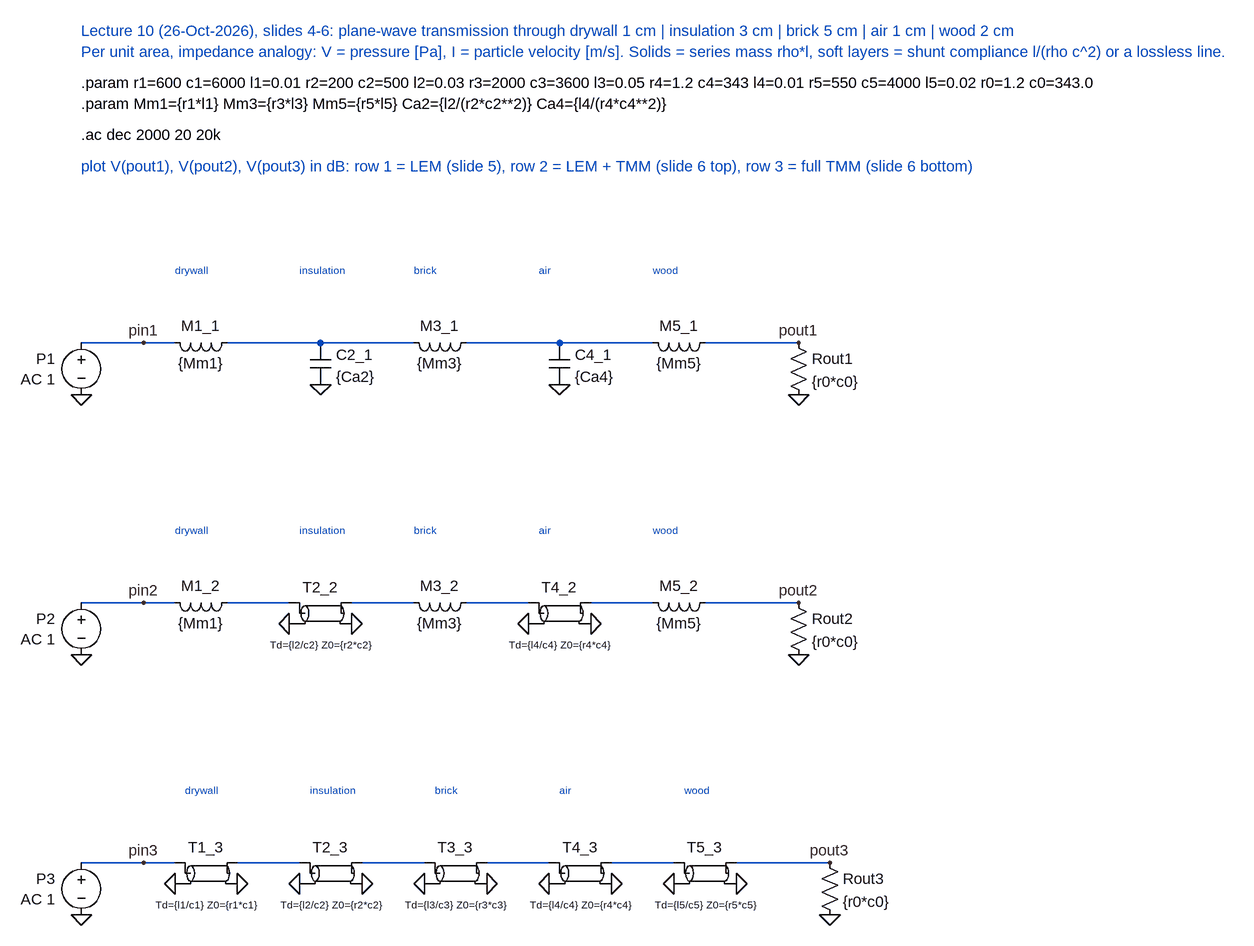
[diagram p0: schematic P10_Wall_LEM_TMM.asc]
P10_Wall_LEM_TMM.asc, the LTspice schematic file:
Version 4
SHEET 1 3000 1600
WIRE 0 0 96 0
WIRE 96 0 144 0
WIRE 224 0 272 0
WIRE 272 0 368 0
WIRE 368 0 464 0
WIRE 464 0 512 0
WIRE 592 0 640 0
WIRE 640 0 736 0
WIRE 736 0 832 0
WIRE 832 0 880 0
WIRE 960 0 1008 0
WIRE 1008 0 1104 0
WIRE 0 400 96 400
WIRE 96 400 144 400
WIRE 224 400 272 400
WIRE 272 400 320 400
WIRE 416 400 464 400
WIRE 464 400 512 400
WIRE 592 400 640 400
WIRE 640 400 688 400
WIRE 784 400 832 400
WIRE 832 400 880 400
WIRE 960 400 1008 400
WIRE 1008 400 1104 400
WIRE 0 800 96 800
WIRE 96 800 144 800
WIRE 240 800 288 800
WIRE 288 800 336 800
WIRE 432 800 480 800
WIRE 480 800 528 800
WIRE 624 800 672 800
WIRE 672 800 720 800
WIRE 816 800 864 800
WIRE 864 800 912 800
WIRE 1008 800 1056 800
WIRE 1056 800 1152 800
FLAG 0 80 0
FLAG 96 0 pin1
FLAG 368 64 0
FLAG 736 64 0
FLAG 1104 0 pout1
FLAG 1104 80 0
FLAG 0 480 0
FLAG 96 400 pin2
FLAG 320 432 0
FLAG 416 432 0
FLAG 688 432 0
FLAG 784 432 0
FLAG 1104 400 pout2
FLAG 1104 480 0
FLAG 0 880 0
FLAG 96 800 pin3
FLAG 144 832 0
FLAG 240 832 0
FLAG 336 832 0
FLAG 432 832 0
FLAG 528 832 0
FLAG 624 832 0
FLAG 720 832 0
FLAG 816 832 0
FLAG 912 832 0
FLAG 1008 832 0
FLAG 1152 800 pout3
FLAG 1152 880 0
SYMBOL voltage 0 -16 R0
WINDOW 0 -40 40 Right 2
WINDOW 3 -40 72 Right 2
SYMATTR InstName P1
SYMATTR Value AC 1
SYMBOL ind 240 -16 R90
WINDOW 0 5 56 VBottom 2
WINDOW 3 32 56 VTop 2
SYMATTR InstName M1_1
SYMATTR Value {Mm1}
SYMATTR SpiceLine Rser=0
SYMBOL cap 352 0 R0
WINDOW 0 40 18 Left 2
WINDOW 3 40 52 Left 2
SYMATTR InstName C2_1
SYMATTR Value {Ca2}
SYMBOL ind 608 -16 R90
WINDOW 0 5 56 VBottom 2
WINDOW 3 32 56 VTop 2
SYMATTR InstName M3_1
SYMATTR Value {Mm3}
SYMATTR SpiceLine Rser=0
SYMBOL cap 720 0 R0
WINDOW 0 40 18 Left 2
WINDOW 3 40 52 Left 2
SYMATTR InstName C4_1
SYMATTR Value {Ca4}
SYMBOL ind 976 -16 R90
WINDOW 0 5 56 VBottom 2
WINDOW 3 32 56 VTop 2
SYMATTR InstName M5_1
SYMATTR Value {Mm5}
SYMATTR SpiceLine Rser=0
SYMBOL res 1088 -16 R0
SYMATTR InstName Rout1
SYMATTR Value {r0*c0}
SYMBOL voltage 0 384 R0
WINDOW 0 -40 40 Right 2
WINDOW 3 -40 72 Right 2
SYMATTR InstName P2
SYMATTR Value AC 1
SYMBOL ind 240 384 R90
WINDOW 0 5 56 VBottom 2
WINDOW 3 32 56 VTop 2
SYMATTR InstName M1_2
SYMATTR Value {Mm1}
SYMATTR SpiceLine Rser=0
SYMBOL tline 368 416 R0
WINDOW 0 0 -40 Center 2
WINDOW 3 0 48 Center 1
SYMATTR InstName T2_2
SYMATTR Value Td={l2/c2} Z0={r2*c2}
SYMBOL ind 608 384 R90
WINDOW 0 5 56 VBottom 2
WINDOW 3 32 56 VTop 2
SYMATTR InstName M3_2
SYMATTR Value {Mm3}
SYMATTR SpiceLine Rser=0
SYMBOL tline 736 416 R0
WINDOW 0 0 -40 Center 2
WINDOW 3 0 48 Center 1
SYMATTR InstName T4_2
SYMATTR Value Td={l4/c4} Z0={r4*c4}
SYMBOL ind 976 384 R90
WINDOW 0 5 56 VBottom 2
WINDOW 3 32 56 VTop 2
SYMATTR InstName M5_2
SYMATTR Value {Mm5}
SYMATTR SpiceLine Rser=0
SYMBOL res 1088 384 R0
SYMATTR InstName Rout2
SYMATTR Value {r0*c0}
SYMBOL voltage 0 784 R0
WINDOW 0 -40 40 Right 2
WINDOW 3 -40 72 Right 2
SYMATTR InstName P3
SYMATTR Value AC 1
SYMBOL tline 192 816 R0
WINDOW 0 0 -40 Center 2
WINDOW 3 0 48 Center 1
SYMATTR InstName T1_3
SYMATTR Value Td={l1/c1} Z0={r1*c1}
SYMBOL tline 384 816 R0
WINDOW 0 0 -40 Center 2
WINDOW 3 0 48 Center 1
SYMATTR InstName T2_3
SYMATTR Value Td={l2/c2} Z0={r2*c2}
SYMBOL tline 576 816 R0
WINDOW 0 0 -40 Center 2
WINDOW 3 0 48 Center 1
SYMATTR InstName T3_3
SYMATTR Value Td={l3/c3} Z0={r3*c3}
SYMBOL tline 768 816 R0
WINDOW 0 0 -40 Center 2
WINDOW 3 0 48 Center 1
SYMATTR InstName T4_3
SYMATTR Value Td={l4/c4} Z0={r4*c4}
SYMBOL tline 960 816 R0
WINDOW 0 0 -40 Center 2
WINDOW 3 0 48 Center 1
SYMATTR InstName T5_3
SYMATTR Value Td={l5/c5} Z0={r5*c5}
SYMBOL res 1136 784 R0
SYMATTR InstName Rout3
SYMATTR Value {r0*c0}
TEXT 0 -480 Left 2 ;Lecture 10 (26-Oct-2026), slides 4-6: plane-wave transmission through drywall 1 cm | insulation 3 cm | brick 5 cm | air 1 cm | wood 2 cm
TEXT 0 -448 Left 2 ;Per unit area, impedance analogy: V = pressure [Pa], I = particle velocity [m/s]. Solids = series mass rho*l, soft layers = shunt compliance l/(rho c^2) or a lossless line.
TEXT 0 -400 Left 2 !.param r1=600 c1=6000 l1=0.01 r2=200 c2=500 l2=0.03 r3=2000 c3=3600 l3=0.05 r4=1.2 c4=343 l4=0.01 r5=550 c5=4000 l5=0.02 r0=1.2 c0=343.0
TEXT 0 -368 Left 2 !.param Mm1={r1*l1} Mm3={r3*l3} Mm5={r5*l5} Ca2={l2/(r2*c2**2)} Ca4={l4/(r4*c4**2)}
TEXT 0 -320 Left 2 !.ac dec 2000 20 20k
TEXT 0 -272 Left 2 ;plot V(pout1), V(pout2), V(pout3) in dB: row 1 = LEM (slide 5), row 2 = LEM + TMM (slide 6 top), row 3 = full TMM (slide 6 bottom)
TEXT 144 -112 Left 1 ;drywall
TEXT 336 -112 Left 1 ;insulation
TEXT 512 -112 Left 1 ;brick
TEXT 704 -112 Left 1 ;air
TEXT 880 -112 Left 1 ;wood
TEXT 144 288 Left 1 ;drywall
TEXT 336 288 Left 1 ;insulation
TEXT 512 288 Left 1 ;brick
TEXT 704 288 Left 1 ;air
TEXT 880 288 Left 1 ;wood
TEXT 160 688 Left 1 ;drywall
TEXT 352 688 Left 1 ;insulation
TEXT 544 688 Left 1 ;brick
TEXT 736 688 Left 1 ;air
TEXT 928 688 Left 1 ;wood

The netlist it stands for:
* P10_Wall_LEM_TMM.asc
V§P1 pin1 0 AC 1
L§M1_1 N001 pin1 {Mm1} Rser=0
C2_1 N001 0 {Ca2}
L§M3_1 N002 N001 {Mm3} Rser=0
C4_1 N002 0 {Ca4}
L§M5_1 pout1 N002 {Mm5} Rser=0
Rout1 pout1 0 {r0*c0}
V§P2 pin2 0 AC 1
L§M1_2 N003 pin2 {Mm1} Rser=0
T2_2 N003 0 N004 0 Td={l2/c2} Z0={r2*c2}
L§M3_2 N005 N004 {Mm3} Rser=0
T4_2 N005 0 N006 0 Td={l4/c4} Z0={r4*c4}
L§M5_2 pout2 N006 {Mm5} Rser=0
Rout2 pout2 0 {r0*c0}
V§P3 pin3 0 AC 1
T1_3 pin3 0 N007 0 Td={l1/c1} Z0={r1*c1}
T2_3 N007 0 N008 0 Td={l2/c2} Z0={r2*c2}
T3_3 N008 0 N009 0 Td={l3/c3} Z0={r3*c3}
T4_3 N009 0 N010 0 Td={l4/c4} Z0={r4*c4}
T5_3 N010 0 pout3 0 Td={l5/c5} Z0={r5*c5}
Rout3 pout3 0 {r0*c0}
* Lecture 10 (26-Oct-2026), slides 4-6: plane-wave transmission through drywall 1 cm | insulation 3 cm | brick 5 cm | air 1 cm | wood 2 cm
* Per unit area, impedance analogy: V = pressure [Pa], I = particle velocity [m/s]. Solids = series mass rho*l, soft layers = shunt compliance l/(rho c^2) or a lossless line.
.param r1=600 c1=6000 l1=0.01 r2=200 c2=500 l2=0.03 r3=2000 c3=3600 l3=0.05 r4=1.2 c4=343 l4=0.01 r5=550 c5=4000 l5=0.02 r0=1.2 c0=343.0
.param Mm1={r1*l1} Mm3={r3*l3} Mm5={r5*l5} Ca2={l2/(r2*c2**2)} Ca4={l4/(r4*c4**2)}
.ac dec 2000 20 20k
* plot V(pout1), V(pout2), V(pout3) in dB: row 1 = LEM (slide 5), row 2 = LEM + TMM (slide 6 top), row 3 = full TMM (slide 6 bottom)
* drywall
* insulation
* brick
* air
* wood
* drywall
* insulation
* brick
* air
* wood
* drywall
* insulation
* brick
* air
* wood
.backanno
.end